# Altium schematic sheet DAC_VOCT.SchDoc
size A4; SheetNumber: 3; SheetTotal: 12
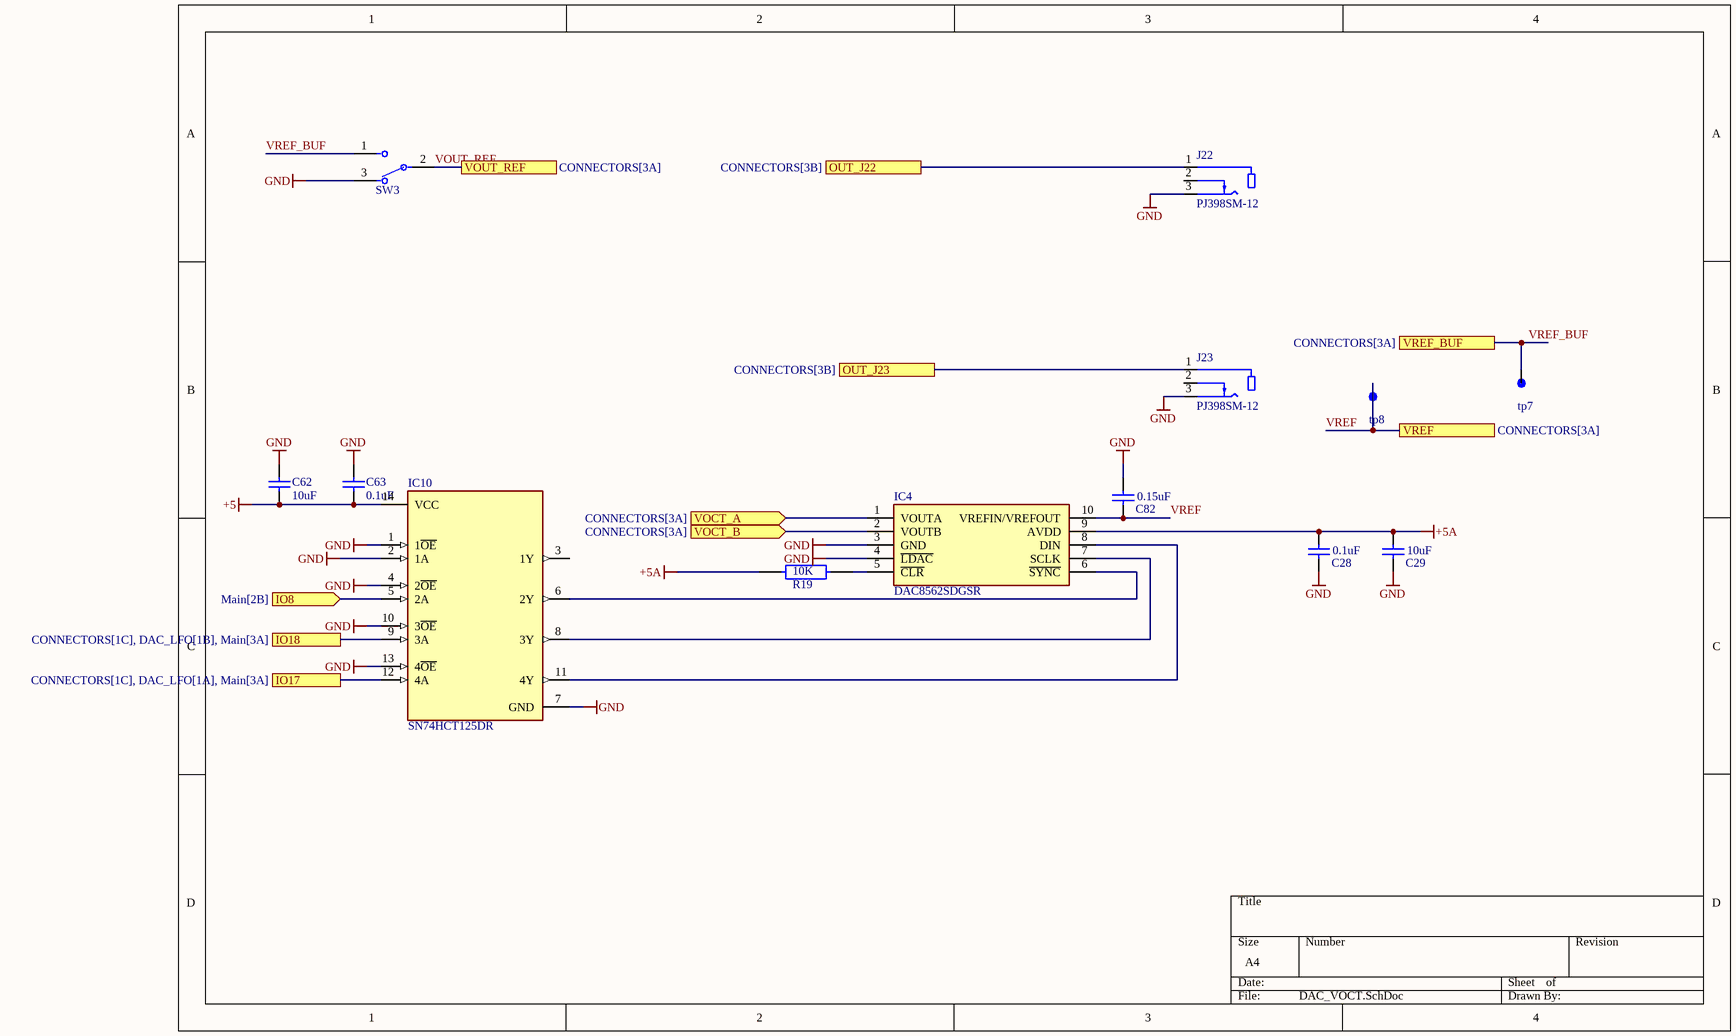
[diagram p0: DAC_VOCT.SchDoc]

## Parts
C28  0.1uF  [CAPC2013X145X48NL20T23]
C29  10uF  [CAPC2013X145X48NL20T23]
C62  10uF  [CAPC2013X145X48NL20T23]
C63  0.1uF  [CAPC2013X145X48NL20T23]
C82  0.15uF  [CAPC2013X145X48NL20T23]
IC4  DAC8562SDGSR  [SOP50P490X110-10N]
IC10  SN74HCT125DR  [FP-D0014A-IPC_B]
J22  PJ398SM-12  [THONK_PJ398SM-12]
J23  PJ398SM-12  [THONK_PJ398SM-12]
R19  10K  [FP-RN73R2A-IPC_A]
SW3  7101SD9CQE  [FP-7101SD9CQE-MFG]  (value not drawn)
tp7  Test point  [TP]  (value not drawn)
tp8  Test point  [TP]  (value not drawn)

## Ports
IO8 (in, see Main[2B]), IO17 (see CONNECTORS[1C], DAC_LFO[1A], Main[3A]), IO18 (see CONNECTORS[1C], DAC_LFO[1B], Main[3A]), OUT_J22 (see CONNECTORS[3B]), OUT_J23 (see CONNECTORS[3B]), VOCT_A (see CONNECTORS[3A]), VOCT_B (see CONNECTORS[3A]), VOUT_REF (see CONNECTORS[3A]), VREF (see CONNECTORS[3A]), VREF_BUF (see CONNECTORS[3A])

## Nets
+5: C62.2 C63.2 IC10.14(VCC)
+5A: C28.2 C29.2 IC4.9(AVDD) R19.2
GND: C28.1 C29.1 C62.1 C63.1 C82.2 IC4.3(GND) IC4.4(~{LDAC}) IC10.1(1~{OE}) IC10.2(1A) IC10.4(2~{OE}) IC10.7(GND) IC10.10(3~{OE}) IC10.13(4~{OE}) J22.3 J23.3 SW3.3
IO8: IC10.5(2A) ; port IO8
IO17: IC10.12(4A) ; port IO17
IO18: IC10.9(3A) ; port IO18
OUT_J22: J22.1 ; port OUT_J22
OUT_J23: J23.1 ; port OUT_J23
VOCT_A: IC4.1(VOUTA) ; port VOCT_A
VOCT_B: IC4.2(VOUTB) ; port VOCT_B
VOUT_REF: SW3.2(COMM) ; port VOUT_REF
VREF: C82.1 IC4.10(VREFIN/VREFOUT) tp8.1 ; port VREF
VREF_BUF: SW3.1 tp7.1 ; port VREF_BUF
NetIC4_5: IC4.5(~{CLR}) R19.1
NetIC4_6: IC4.6(~{SYNC}) IC10.6(2Y)
NetIC4_7: IC4.7(SCLK) IC10.8(3Y)
NetIC4_8: IC4.8(DIN) IC10.11(4Y)

Not connected (* = marked no-connect by the designer): IC10 3(1Y); J22 2; J23 2

## Library data of the parts
C28 C29 C62 C63 C82 = CAP: Manufacturer: Vitramon; Part Number: VJ0805Y682KXAMT
IC4 = DAC8562SDGSR: 16-bit, dual-channel, low-power, ultra-low glitch, voltage output DAC with 2.5V, 4ppm/C reference; Manufacturer_Name: Texas Instruments; Geometry.Height: 1.1mm; Mouser Part Number: 595-DAC8562SDGSR; Mouser Price/Stock: https://www.mouser.co.uk/ProductDetail/Texas-Instruments/DAC8562SDGSR?qs=L4ss%2FyqpMWQjhHzbOFnTNg%3D%3D; Manufacturer_Part_Number: DAC8562SDGSR; Datasheet Link: http://www.ti.com/lit/gpn/dac8562
IC10 = 74HCT125: IC BUF NON-INVERT 5.5V 14SOIC; Number of Input Lines: 4; Polarity: Non-Inverting; Logic Function: Buffer; Low Level Output Current: 6mA; Operating Supply Voltage: 5V; Min Supply Voltage: 4.5V; Quiescent Current: 8uA; Propagation Delay: 50ns; Number of Bits per Element: 1; High Level Output Current: -6mA; Turn-On Delay Time: 36ns; Width: 3.91mm; Max Supply Voltage: 5.5V; Number of Circuits: 4; Max Operating Temperature: 85°C; Radiation Hardening: No; Number of Outputs: 4; Case/Package: SOIC; Length: 8.65mm; Number of Output Lines: 4; Number of Pins: 14; Package Quantity: 2500; Number of Inputs: 4; Mount: Surface Mount; Min Operating Temperature: -40°C; Number of Bits: 4; REACH SVHC: No SVHC; Height: 1.58mm; Contact Plating: Gold; Lead Free: Lead Free; Number of Channels: 4; Number of Elements: 4; Packaging: Tape and Reel; RoHS Compliant: Yes
J22 J23 = PJ398SM-12: 3.5mm Switching Jack Socket; MF: Thonk; Availability: Not in stock; Price: None; Package: Package; MP: PJ398SM-12; Value: *
R19 = Resistor: RES 10K OHM 0.1% 1/8W 0805
SW3 = SPDT: 7101SD9CQE Toggle Switch, Spdt, On-On, Maintained, 5A, 28Vdc, 3 Pcb Hole Cnt, Solder Terminal, Toggle; NexarPartId: 55410166; Voltage Rating (AC): 120V; Max Voltage Rating (DC): 28V; Illumination Type: Illuminated, Non-Illuminated; Contact Resistance: 10mΩ; Actuator Material: Brass, Chrome; Life (Cycles): 100kcycles; Max Voltage Rating (AC): 250V; Actuator Length: 12.45mm; Max Current Rating: 5A; Contact Current Rating: 5A; Termination: PC Pins; Min Operating Temperature: -30°C; Depth: 6.86mm; Orientation: Straight; Voltage Rating (DC): 28V; Length: 12.7mm; RoHS: Compliant; Housing Material: Stainless Steel; Contact Material: Silver; Contact Plating: Silver; Radiation Hardening: No; Current Rating: 5A; Lead Free: Lead Free; Switch Function: On-On; Mount: Through Hole; Electrical Life: 100kcycles; Throw Configuration: SPDT; Max Operating Temperature: 85°C
tp7 tp8 = Testpoint: Value: Test point